# Altium project Automotive_Ethernet_Rev1.PrjPcb (part 1 of 4)
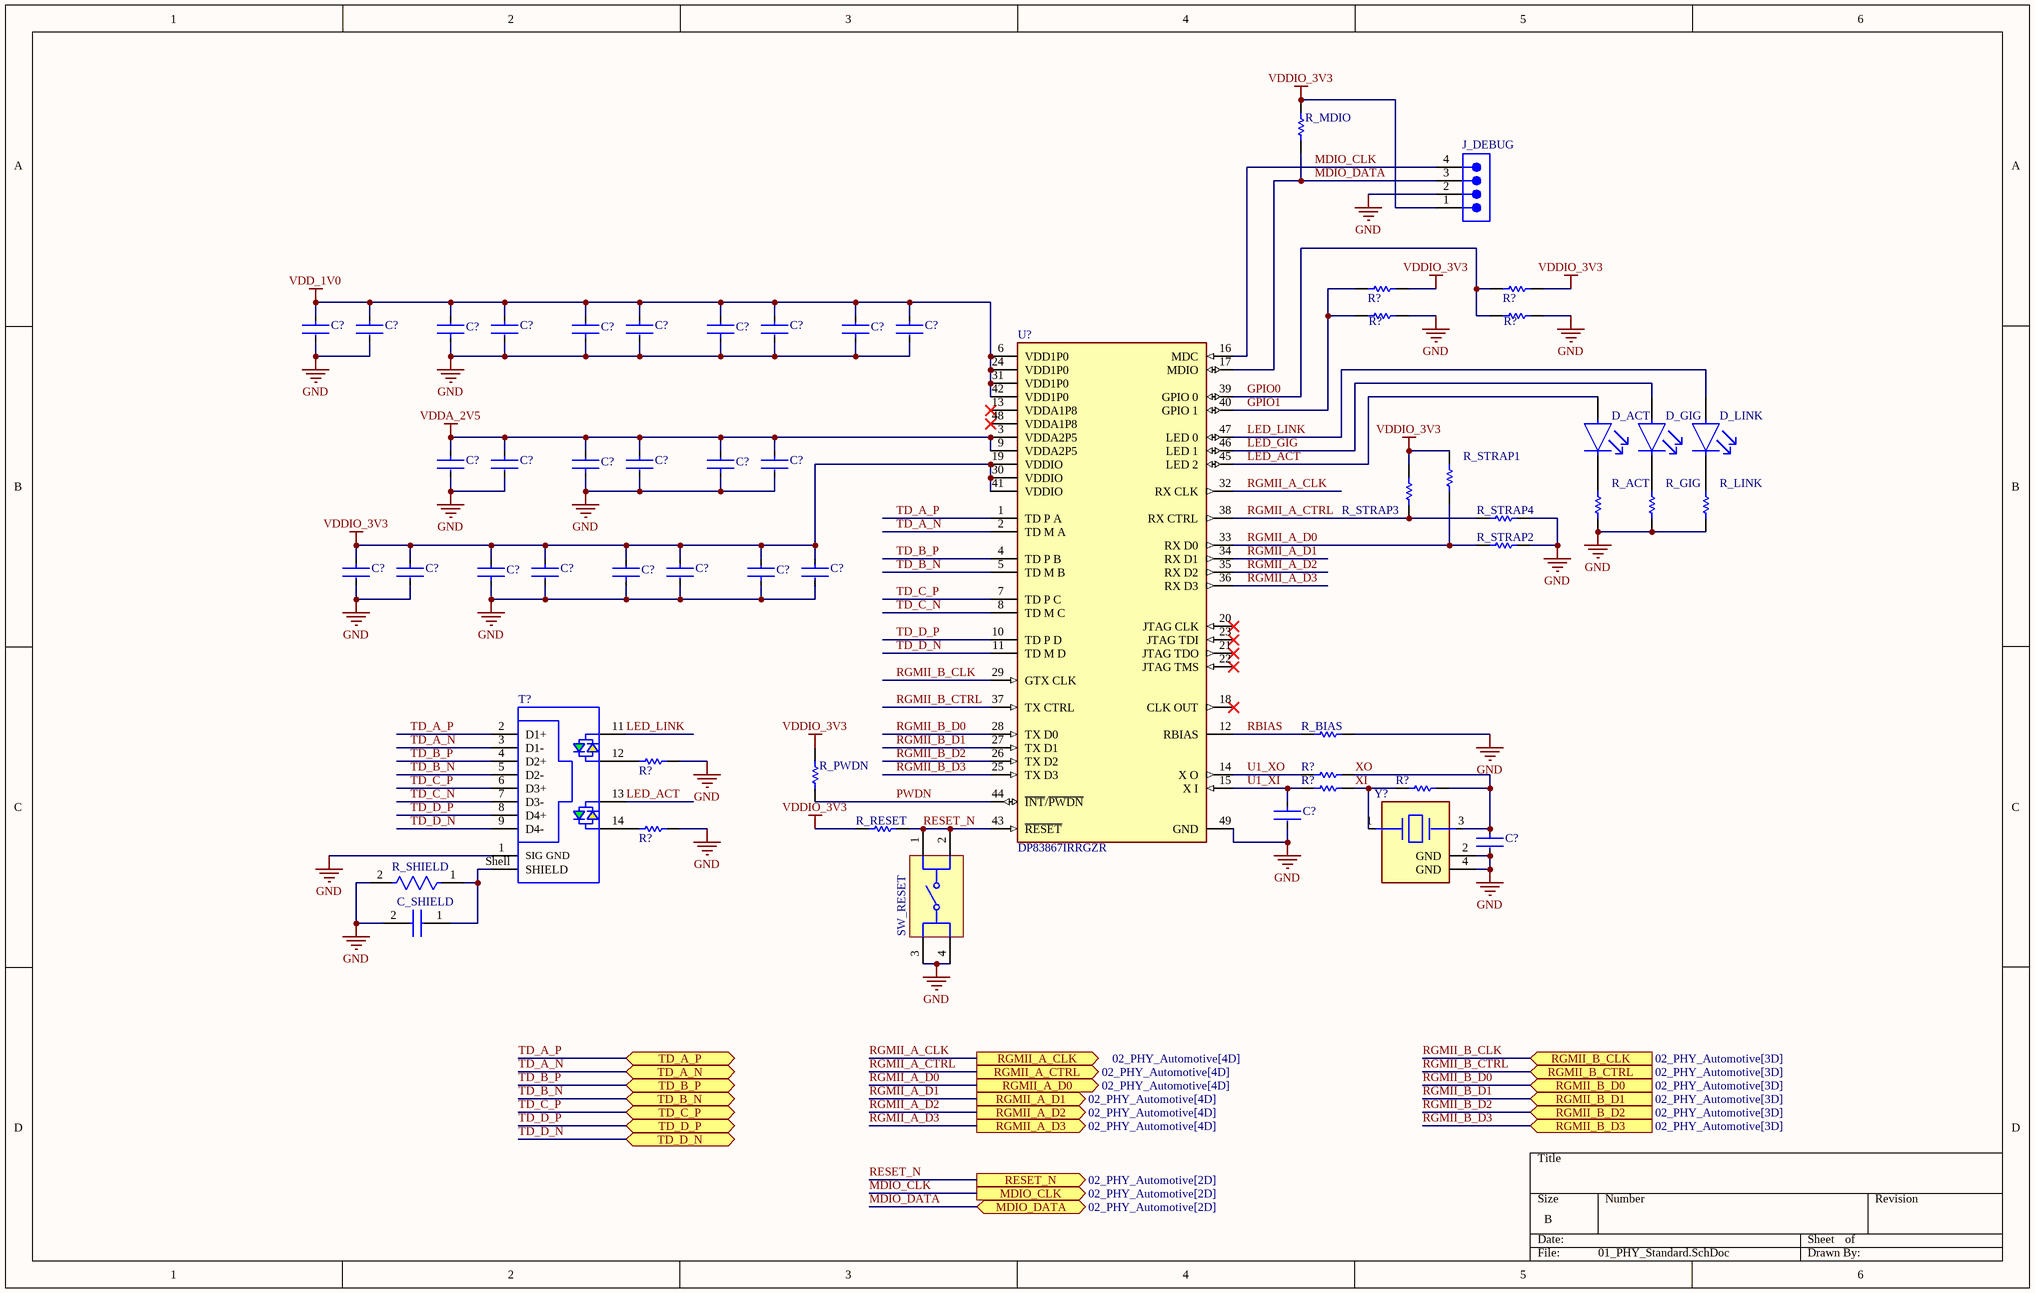
[diagram p0: 01_PHY_Standard.SchDoc]
5 sheets, 134 parts. Net scope: flat (ports and power ports of the same name join across sheets).
Board file: PCB1.PcbDoc
Sheets:
  01_PHY_Standard.SchDoc
  02_PHY_Automotive.SchDoc
  03_Clock_Control.SchDoc
  04_Power.SchDoc
  05_Connectors_Protection.SchDoc

## Sheet 01_PHY_Standard.SchDoc
size B; SheetNumber: 1; SheetTotal: 5

### Parts
(Parts that share a designator on the sheet are numbered #1, #2 ... from top to bottom, then left to right.)
C?#1  C1206C106K4RACAUTO  [FP-C1206C-EH-MFG]  (value not drawn)
C?#2  AC0402KRX7R7BB103  [FP-AC0402-0_5-MFG]  (value not drawn)
C?#3  GCG155R71C104KA01D  [FP-GCG155-0_1-IPC_C]  (value not drawn)
C?#4  GCG155R71C104KA01D  [FP-GCG155-0_1-IPC_C]  (value not drawn)
C?#5  GCG155R71C104KA01D  [FP-GCG155-0_1-IPC_C]  (value not drawn)
C?#6  GCG155R71C104KA01D  [FP-GCG155-0_1-IPC_C]  (value not drawn)
C?#7  C0603C105K8RACAUTO  [FP-C0603-CJ-MFG]  (value not drawn)
C?#8  C0603C105K8RACAUTO  [FP-C0603-CJ-MFG]  (value not drawn)
C?#9  C0603C105K8RACAUTO  [FP-C0603-CJ-MFG]  (value not drawn)
C?#10  C0603C105K8RACAUTO  [FP-C0603-CJ-MFG]  (value not drawn)
C?#11  C1206C106K4RACAUTO  [FP-C1206C-EH-MFG]  (value not drawn)
C?#12  AC0402KRX7R7BB103  [FP-AC0402-0_5-MFG]  (value not drawn)
C?#13  GCG155R71C104KA01D  [FP-GCG155-0_1-IPC_C]  (value not drawn)
C?#14  GCG155R71C104KA01D  [FP-GCG155-0_1-IPC_C]  (value not drawn)
C?#15  C0603C105K8RACAUTO  [FP-C0603-CJ-MFG]  (value not drawn)
C?#16  C0603C105K8RACAUTO  [FP-C0603-CJ-MFG]  (value not drawn)
C?#17  C1206C106K4RACAUTO  [FP-C1206C-EH-MFG]  (value not drawn)
C?#18  AC0402KRX7R7BB103  [FP-AC0402-0_5-MFG]  (value not drawn)
C?#19  GCG155R71C104KA01D  [FP-GCG155-0_1-IPC_C]  (value not drawn)
C?#20  GCG155R71C104KA01D  [FP-GCG155-0_1-IPC_C]  (value not drawn)
C?#21  GCG155R71C104KA01D  [FP-GCG155-0_1-IPC_C]  (value not drawn)
C?#22  C0603C105K8RACAUTO  [FP-C0603-CJ-MFG]  (value not drawn)
C?#23  C0603C105K8RACAUTO  [FP-C0603-CJ-MFG]  (value not drawn)
C?#24  C0603C105K8RACAUTO  [FP-C0603-CJ-MFG]  (value not drawn)
C?#25  AC0402FRNPO9BN270  [FP-AC0402-0_5-MFG]  (value not drawn)
C?#26  AC0402FRNPO9BN270  [FP-AC0402-0_5-MFG]  (value not drawn)
C_SHIELD  C1812C472KGRACAUTO  [C1812]  (value not drawn)
D_ACT  SML-D12P8WT86C  [FP-SML-D12-MFG]  (value not drawn)
D_GIG  SML-D12P8WT86C  [FP-SML-D12-MFG]  (value not drawn)
D_LINK  SML-D12P8WT86C  [FP-SML-D12-MFG]  (value not drawn)
J_DEBUG  MTSW-104-07-F-S-170  [SMTC-MTSW-104-07-X-S-170]  (value not drawn)
R?#1  AC0402FR-075K76L  [FP-AC0402-IPC_A]  (value not drawn)
R?#2  AC0402FR-075K76L  [FP-AC0402-IPC_A]  (value not drawn)
R?#3  AC0402FR-072K49L  [FP-AC0402-IPC_A]  (value not drawn)
R?#4  AC0402FR-072K49L  [FP-AC0402-IPC_A]  (value not drawn)
R?#5  AC0402JR-13470RL  [FP-AC0402-IPC_A]  (value not drawn)
R?#6  AF0402JR-070RL  [FP-AC0402-IPC_A]  (value not drawn)
R?#7  AF0402JR-070RL  [FP-AC0402-IPC_A]  (value not drawn)
R?#8  AF0402JR-071ML  [FP-AC0402-IPC_A]  (value not drawn)
R?#9  AC0402JR-13470RL  [FP-AC0402-IPC_A]  (value not drawn)
R_ACT  AC0402JR-13470RL  [FP-AC0402-IPC_A]  (value not drawn)
R_BIAS  AC0402FR-0711KL  [FP-AC0402-IPC_A]  (value not drawn)
R_GIG  AC0402JR-13470RL  [FP-AC0402-IPC_A]  (value not drawn)
R_LINK  AC0402JR-13470RL  [FP-AC0402-IPC_A]  (value not drawn)
R_MDIO  CRCW04022K20FKTD  [FP-AC0402-IPC_A]  (value not drawn)
R_PWDN  CRCW04022K20FKTD  [FP-AC0402-IPC_A]  (value not drawn)
R_RESET  AC0402JR-1310KL  [FP-AC0402-IPC_A]  (value not drawn)
R_SHIELD  AF1206JR-071ML  [FP-AF1206-MFG]  (value not drawn)
R_STRAP1  AC0402JR-1310KL  [FP-AC0402-IPC_A]  (value not drawn)
R_STRAP2  AC0402FR-072K49L  [FP-AC0402-IPC_A]  (value not drawn)
R_STRAP3  AC0402FR-075K76L  [FP-AC0402-IPC_A]  (value not drawn)
R_STRAP4  AC0402FR-072K49L  [FP-AC0402-IPC_A]  (value not drawn)
SW_RESET  430473035826  [430473035826]  (value not drawn)
T?  74991104404  [74991104404]  (value not drawn)
U?#1  DP83867IRRGZR  [FP-RGZ0048B-MFG]
Y?#1  TSX-3225 25.0000MF10P-C0  [FP-TSX-3225-MFG]  (value not drawn)

### Ports
MDIO_CLK (out, see 02_PHY_Automotive[2D]), MDIO_DATA (bidir, see 02_PHY_Automotive[2D]), RESET_N (out, see 02_PHY_Automotive[2D]), RGMII_A_CLK (out, see 02_PHY_Automotive[4D]), RGMII_A_CTRL (out, see 02_PHY_Automotive[4D]), RGMII_A_D0 (out, see 02_PHY_Automotive[4D]), RGMII_A_D1 (out, see 02_PHY_Automotive[4D]), RGMII_A_D2 (out, see 02_PHY_Automotive[4D]), RGMII_A_D3 (out, see 02_PHY_Automotive[4D]), RGMII_B_CLK (in, see 02_PHY_Automotive[3D]), RGMII_B_CTRL (in, see 02_PHY_Automotive[3D]), RGMII_B_D0 (in, see 02_PHY_Automotive[3D]), RGMII_B_D1 (in, see 02_PHY_Automotive[3D]), RGMII_B_D2 (in, see 02_PHY_Automotive[3D]), RGMII_B_D3 (in, see 02_PHY_Automotive[3D]), TD_A_N (bidir), TD_A_P (bidir), TD_B_N (bidir), TD_B_P (bidir), TD_C_P (bidir), TD_D_N (bidir), TD_D_P (bidir)

### Nets
GND: C?#1.2 C?#2.2 C?#3.2 C?#4.2 C?#5.2 C?#6.2 C?#7.2 C?#8.2 C?#9.2 C?#10.2 C?#11.2 C?#12.2 C?#13.2 C?#14.2 C?#15.2 C?#16.2 C?#17.2 C?#18.2 C?#19.2 C?#20.2 C?#21.2 C?#22.2 C?#23.2 C?#24.2 C?#25.2 C?#26.2 C_SHIELD.2 J_DEBUG.2 R?#3.1 R?#4.1 R?#5.2 R?#9.2 R_ACT.2 R_BIAS.1 R_GIG.2 R_LINK.2 R_SHIELD.2 R_STRAP2.1 R_STRAP4.1 SW_RESET.3 SW_RESET.4 T?.1(SIG_GND) U?#1.49(GND) Y?#1.2(GND) Y?#1.4(GND)
VDD_1V0: C?#1.1 C?#2.1 C?#3.1 C?#4.1 C?#5.1 C?#6.1 C?#7.1 C?#8.1 C?#9.1 C?#10.1 U?#1.6(VDD1P0) U?#1.24(VDD1P0) U?#1.31(VDD1P0) U?#1.42(VDD1P0)
VDDA_2V5: C?#11.1 C?#12.1 C?#13.1 C?#14.1 C?#15.1 C?#16.1 U?#1.3(VDDA2P5) U?#1.9(VDDA2P5)
VDDIO_3V3: C?#17.1 C?#18.1 C?#19.1 C?#20.1 C?#21.1 C?#22.1 C?#23.1 C?#24.1 J_DEBUG.1 R?#1.2 R?#2.2 R_MDIO.1 R_PWDN.1 R_RESET.2 R_STRAP1.1 R_STRAP3.1 U?#1.19(VDDIO) U?#1.30(VDDIO) U?#1.41(VDDIO)
GPIO0: R?#2.1 R?#4.2 U?#1.39(GPIO_0)
GPIO1: R?#1.1 R?#3.2 U?#1.40(GPIO_1)
LED_ACT: D_ACT.2(A) T?.13 U?#1.45(LED_2)
LED_GIG: D_GIG.2(A) U?#1.46(LED_1)
LED_LINK: D_LINK.2(A) T?.11 U?#1.47(LED_0)
MDIO_CLK: J_DEBUG.4 U?#1.16(MDC) ; port MDIO_CLK
MDIO_DATA: J_DEBUG.3 R_MDIO.2 U?#1.17(MDIO) ; port MDIO_DATA
PWDN: R_PWDN.2 U?#1.44(~{INT}/~{PWDN})
RBIAS: R_BIAS.2 U?#1.12(RBIAS)
RESET_N: R_RESET.1 SW_RESET.1 SW_RESET.2 U?#1.43(~{RESET}) ; port RESET_N
RGMII_A_CLK: U?#1.32(RX_CLK) ; port RGMII_A_CLK
RGMII_A_CTRL: R_STRAP3.2 R_STRAP4.2 U?#1.38(RX_CTRL) ; port RGMII_A_CTRL
RGMII_A_D0: R_STRAP1.2 R_STRAP2.2 U?#1.33(RX_D0) ; port RGMII_A_D0
RGMII_A_D1: U?#1.34(RX_D1) ; port RGMII_A_D1
RGMII_A_D2: U?#1.35(RX_D2) ; port RGMII_A_D2
RGMII_A_D3: U?#1.36(RX_D3) ; port RGMII_A_D3
RGMII_B_CLK: U?#1.29(GTX_CLK) ; port RGMII_B_CLK
RGMII_B_CTRL: U?#1.37(TX_CTRL) ; port RGMII_B_CTRL
RGMII_B_D0: U?#1.28(TX_D0) ; port RGMII_B_D0
RGMII_B_D1: U?#1.27(TX_D1) ; port RGMII_B_D1
RGMII_B_D2: U?#1.26(TX_D2) ; port RGMII_B_D2
RGMII_B_D3: U?#1.25(TX_D3) ; port RGMII_B_D3
TD_A_N: T?.3(D1-) U?#1.2(TD_M_A) ; port TD_A_N
TD_A_P: T?.2(D1+) U?#1.1(TD_P_A) ; port TD_A_P
TD_B_N: T?.5(D2-) U?#1.5(TD_M_B) ; port TD_B_N
TD_B_P: T?.4(D2+) U?#1.4(TD_P_B) ; port TD_B_P
TD_C_N: T?.7(D3-) U?#1.8(TD_M_C)
TD_C_P: T?.6(D3+) U?#1.7(TD_P_C) ; port TD_C_P
TD_D_N: T?.9(D4-) U?#1.11(TD_M_D) ; port TD_D_N
TD_D_P: T?.8(D4+) U?#1.10(TD_P_D) ; port TD_D_P
U1_XI: C?#25.1 R?#7.2 U?#1.15(X_I)
U1_XO: R?#6.2 U?#1.14(X_O)
XI: R?#7.1 R?#8.2 Y?#1.1
XO: C?#26.1 R?#6.1 R?#8.1 Y?#1.3
NetC_SHIELD_1: C_SHIELD.1 R_SHIELD.1 T?.Shell(SHIELD)
NetD_ACT_1: D_ACT.1(C) R_ACT.1
NetD_GIG_1: D_GIG.1(C) R_GIG.1
NetD_LINK_1: D_LINK.1(C) R_LINK.1
NetR?#5_1: R?#5.1 T?.12
NetR?#9_1: R?#9.1 T?.14

Not connected (* = marked no-connect by the designer): U?#1 13(VDDA1P8)* 18(CLK_OUT)* 20(JTAG_CLK)* 21(JTAG_TDO)* 22(JTAG_TMS)* 23(JTAG_TDI)* 48(VDDA1P8)*

### Library data of the parts
C?#1 C?#11 C?#17 = CMP-03020-003375-1: CAP CER 10UF 16V X7R 1206; Manufacturer: Kemet; Material: Ceramic; Temperature Coefficient: 15%; Tolerance: 10%; Automotive Grade: Grade 1; Manufacturer Part Number: C1206C106K4RACAUTO; Digikey Description: CAP CER 10UF 16V X7R 1206; RoHS: TRUE; Temperature Range Low: -55°C; Ipc Land Pattern Name: CAPC320160X160; Category: Cap; Mouser Description: Multilayer Ceramic Capacitors MLCC - SMD/SMT 10uF 16V 10% AUTO; Device Class L1: Passive Components; Automotive: Yes; ComponentLink2Description: Datasheet; Octopart: https://octopart.com/c1206c106k4racauto-kemet-20072893; Package: C1206C-EH; Temperature: -55°C to +125°C; Device Class L3: Ceramic Capacitors; Device Class L2: Capacitors; Temperature Range High: +125°C; Capacitance: 10uF; Value: 10uF; Lead Free: Yes; Height: 1.8mm; Temperature Characteristic: X7R; ComponentLink2URL: https://content.kemet.com/datasheets/KEM_C1023_X7R_AUTO_SMD.pdf; Voltage Rating: 16V
C?#2 C?#12 C?#18 = CMP-03422-001135-1: CAP CER 10000PF 16V X7R 0402; Manufacturer: Yageo; Value: 10 nF; Automotive Grade: Grade 1; Temperature Coefficient: ±15%; Tolerance: 0.1; Material: Ceramic; Octopart: https://octopart.com/ac0402krx7r7bb103-yageo-76900920; Height: 0.55mm; Footprint Url: http://www.yageo.com/exep/pages/download/literatures/UPY-C_GEN_24.pdf; Lead Free: Yes; RoHS: TRUE; Digikey Description: CAP CER 10000PF 16V X7R 0402; Temperature Range Low: -55°C; Device Class L1: Passive Components; Voltage Rating: 16 V; Temperature: -55°C to +125°C; Capacitance: 10 nF; Package: AC0402-0.5; ComponentLink2Description: Datasheet; Device Class L3: Ceramic Capacitors; Temperature Range High: +125°C; Ipc Land Pattern Name: CAPC10050X50; Device Class L2: Capacitors; Temperature Characteristic: X7R; Category: Cap; ComponentLink2URL: http://www.yageo.com/documents/recent/UPY-AC_NP0X7R_16V-to-630V_12.pdf; Manufacturer Part Number: AC0402KRX7R7BB103; Automotive: Yes
C?#3-C?#6 C?#13 C?#14 C?#19-C?#21 = CMP-06035-054249-1: Cap Ceramic Multilayer Automotive 0.1uF ±0.1 16VDC X7R 15% 0402 (1005M); Capacitance: 100nF; Tolerance: 10%; Voltage Rating (DC): 16V; Lead Free: Lead Free; Dielectric: X7R
C?#7-C?#10 C?#15 C?#16 C?#22-C?#24 = CMP-03020-024138-1: CAP CER 0603 1UF 10V X7R 10%; Manufacturer: KEMET; Temperature Coefficient: 15%; Automotive Grade: Grade 1; Material: Ceramic; Device Class L3: Ceramic Capacitors; Octopart: https://octopart.com/c0603c105k8racauto-kemet-91328492; Capacitance: 1uF; Voltage Rating: 10V; Device Class L2: Capacitors; Lead Free: Yes; Device Class L1: Passive Components; ComponentLink2URL: https://content.kemet.com/datasheets/KEM_C1023_X7R_AUTO_SMD.pdf; Temperature Characteristic: X7R; Temperature Range Low: -55°C; Temperature Range High: +125°C; Category: Cap; Ipc Land Pattern Name: CAPC16080X80; Tolerance: 10%; Package: C0603-CJ; Manufacturer Part Number: C0603C105K8RACAUTO; ComponentLink2Description: Datasheet; Temperature: -55°C to +125°C; RoHS: TRUE; Value: 1uF; Height: 0.95mm; Automotive: Yes; Digikey Description: CAP CER 0603 1UF 10V X7R 10%
C?#25 C?#26 = CMP-03422-000145-1: AC0402 27 pF NPO 1.00% 50 V; Manufacturer: Yageo; Tolerance: 0.01; Voltage Rating: 50 V; Capacitance: 27 pF; Material: Ceramic; Value: 27 pF; Automotive Grade: Grade 1; Temperature Coefficient: 30ppm/°C; Temperature: -55°C to +125°C; Octopart: https://octopart.com/ac0402frnpo9bn270-yageo-87213989; RoHS: TRUE; Ipc Land Pattern Name: CAPC10050X50; Package: AC0402-0.5; Category: Cap; Device Class L2: Capacitors; Device Class L1: Passive Components; Manufacturer Part Number: AC0402FRNPO9BN270; Automotive: Yes; Device Class L3: Ceramic Capacitors; Footprint Url: http://www.yageo.com/exep/pages/download/literatures/UPY-C_GEN_24.pdf; Temperature Range High: +125°C; Temperature Characteristic: NPO; Height: 0.55mm; ComponentLink2Description: Datasheet; Temperature Range Low: -55°C; Lead Free: Yes; ComponentLink2URL: http://www.yageo.com/documents/recent/UPY-AC_NP0X7R_16V-to-630V_12.pdf
C_SHIELD = C1812C472KGRACAUTO: Capacitor; Manufacturer_Name: Yageo Group; Datasheet Link: https://www.yageogroup.com/content/datasheet/asset/file/KEM_C1076_X7R_HV_AUTO_SMD; Height: 1.55mm; Manufacturer_Part_Number: C1812C472KGRACAUTO; Mouser Part Number: 80-C1812C472KGRAUTO; Mouser Price/Stock: https://www.mouser.co.uk/ProductDetail/KEMET/C1812C472KGRACAUTO?qs=f9yNj16SXrLK%252BHmDDKifeA%3D%3D; Arrow Part Number: C1812C472KGRACAUTO; Arrow Price/Stock: https://www.arrow.com/en/products/c1812c472kgracauto/kemet-corporation
D_ACT D_GIG D_LINK = CMP-08952-000001-1: LED GREEN 1608 SMD; Manufacturer: Rohm; Forward Current: 20mA; Luminous Intensity: 6.3mcd; Wavelength: 560nm; Automotive Grade: Grade 3; Reverse Voltage: 5V; Forward Voltage: 2.2V; Power Dissipation: 54mW; Led Orientation: Top View; Temperature Range Low: -40°C; Automotive: Yes; Height: 0.65mm; Manufacturer Part Number: SML-D12P8WT86C; Device Class L3: unset; Octopart: https://octopart.com/sml-d12p8wt86c-rohm-77740213; Lead Free: Yes; Digikey Description: LED GREEN 1608 SMD; Temperature Range High: +85°C; ComponentLink2URL: https://www.rohm.com/datasheet/SML-D12P8W(C)/sml-d12x8(c)-e; ComponentLink2Description: Datasheet; RoHS: TRUE; Device Class L2: LEDs; Package: SML-D12; Category: Diode; Temperature: -40°C to +85°C; Mouser Description: LED Uni-Color Green Automotive 2-Pin Chip 0603(1608Metric) T/R; Colour: Green; Device Class L1: Optoelectronics
J_DEBUG = CMP-1024-00106-1: Modified .025" SQ Post Header, Through-hole, Vertical, -55 to 125 degC, 2.54 mm Pitch, 4-Pin, Male, RoHS; Manufacturer: Samtec; Pitch: 2.54 mm; Orientation: Vertical; ComponentLink1Description: Manufacturer URL; ComponentLink2Description: Datasheet; PackageReference: MTSW-104-07-X-S-170; PackageDescription: Assembly .025" [.64] SQ Post Terminal Strip; Temperature Range: -55 to 125 degC; PackageVersion: BI, 2/1987; PartNumber: MTSW-104-07-F-S-170; Mounting Technology: Through-hole; ComponentLink2URL: http://www.samtec.com/documents/webfiles/pdf/MTSW.PDF; ComponentLink3URL: http://www.samtec.com/documents/webfiles/cpdf/MTSW-XXX-XX-X-X-XXXX-XX-XXX-MKT1.pdf; DatasheetVersion: F-214; RoHS: True; ComponentLink3Description: Package Specification; ComponentLink1URL: http://www.samtec.com
R?#1 R?#2 R_STRAP3 = CMP-2002-07181-1: Fixed Resistor, Metal Glaze/Thick Film, 0.0625W, 5760ohm, 50V, 1% +/-Tol, Surface Mount, 0402; Manufacturer: Yageo Group; Max Power Dissipation: 63mW; Power Rating: 62.5mW; Value: 5.76kΩ; Temperature Coefficient: 100ppm/°C; Supplier: Future Electronics; Supplier Part Number: AC0402FR-075K76L; Manufacturer Part Number: AC0402FR-075K76L; RoHS: Compliant; Category: Chip SMD Resistors; Stock: 40000; Pricing: 10000=0.0061, 30000=0.0059, 50000=0.0059, 150000=0.0057, 250000=0.0056 (USD); Case/Package: 0402; Case Code (Imperial): 0402; Case Code (Metric): 1005; China RoHS: Non-Compliant; Composition: Thick Film; Country of Origin: Mainland China, Taiwan; Export Control Classification Number (ECCN) Code: EAR99; Features: Automotive AEC-Q200, Moisture Resistant; Height: 320µm; Harmonized Tariff Schedule (HTS) Code: 8533.21.00.30; Introduction Date: 2012-04-10; Length: 1mm; Lifecycle Status: Production; Max Operating Temperature: 155°C; Min Operating Temperature: -55°C; Mounting Technology: Surface Mount; Number of Terminals: 2; Number of Terminations: 2; Packaging: Tape & Reel; Ratings: AEC-Q200; REACH SVHC: Unaffected; Termination: SMD/SMT; Tolerance: 1%; Voltage Rating: 50V; Width: 500µm; Working Voltage: 50V; ComponentLink1URL: https://datasheet.octopart.com:443/AC0402FR-075K76L-Yageo-datasheet-182189377.pdf?src-supplier=IHS; ComponentLink1Description: https://datasheet.octopart.com:443/AC0402FR-075K76L-Yageo-datasheet-182189377.pdf?src-supplier=IHS; ComponentLink2URL: https://datasheet.octopart.com:443/AC0402FR-075K76L-Yageo-datasheet-83209224.pdf?src-supplier=Upverter; ComponentLink2Description: https://datasheet.octopart.com:443/AC0402FR-075K76L-Yageo-datasheet-83209224.pdf?src-supplier=Upverter; ComponentLink3URL: https://datasheet.octopart.com:443/AC0402FR-075K76L-Yageo-datasheet-178509465.pdf?src-supplier=Farnell; ComponentLink3Description: https://datasheet.octopart.com:443/AC0402FR-075K76L-Yageo-datasheet-178509465.pdf?src-supplier=Farnell; ComponentLink4URL: https://datasheet.octopart.com:443/AC0402FR-075K76L-Yageo-Group-datasheet-189830439.pdf?src-supplier=Future+Electronics; ComponentLink4Description: https://datasheet.octopart.com:443/AC0402FR-075K76L-Yageo-Group-datasheet-189830439.pdf?src-supplier=Future+Electronics; ComponentLink5URL: https://datasheet.octopart.com:443/AC0402FR-075K76L-Yageo-datasheet-166720450.pdf?src-supplier=Future+Electronics; ComponentLink5Description: https://datasheet.octopart.com:443/AC0402FR-075K76L-Yageo-datasheet-166720450.pdf?src-supplier=Future+Electronics; ComponentLink6URL: https://datasheet.octopart.com:443/AC0402FR-075K76L-Yageo-datasheet-151884373.pdf?src-supplier=Future+Electronics; ComponentLink6Description: https://datasheet.octopart.com:443/AC0402FR-075K76L-Yageo-datasheet-151884373.pdf?src-supplier=Future+Electronics; ComponentLink7URL: https://datasheet.octopart.com:443/AC0402FR-075K76L-Yageo-Group-datasheet-188689268.pdf?src-supplier=LCSC; ComponentLink7Description: https://datasheet.octopart.com:443/AC0402FR-075K76L-Yageo-Group-datasheet-188689268.pdf?src-supplier=LCSC; ComponentLink8URL: https://datasheet.octopart.com:443/AC0402FR-075K76L-Yageo-Group-datasheet-164768995.pdf?src-supplier=ODG+(Origin+Data+Global); ComponentLink8Description: https://datasheet.octopart.com:443/AC0402FR-075K76L-Yageo-Group-datasheet-164768995.pdf?src-supplier=ODG+(Origin+Data+Global); ComponentLink9URL: https://datasheet.octopart.com/AC0402FR-075K76L-Yageo-datasheet-12512238.pdf; ComponentLink9Description: https://datasheet.octopart.com/AC0402FR-075K76L-Yageo-datasheet-12512238.pdf; ComponentLink10URL: http://sigma.octopart.com:80/conflict_mineral_statement/Yageo-company-3.pdf?src-supplier=Compliance+Statements; ComponentLink10Description: http://sigma.octopart.com:80/conflict_mineral_statement/Yageo-company-3.pdf?src-supplier=Compliance+Statements; ComponentLink11URL: http://sigma.octopart.com:80/rohs_statement/Yageo-company-2.pdf?src-supplier=Compliance+Statements; ComponentLink11Description: http://sigma.octopart.com:80/rohs_statement/Yageo-company-2.pdf?src-supplier=Compliance+Statements
R?#3 R?#4 R_STRAP2 R_STRAP4 = CMP-2002-07181-1: Res Thick Film 0402 2.49K Ohm 1% 0.063W(1/16W) ±100ppm/C Pad SMD Automotive T/R; Manufacturer: Yageo Group; Max Power Dissipation: 63mW; Power Rating: 62.5mW; Value: 2.49kΩ; Temperature Coefficient: 100ppm/°C; Voltage Rating: 50V; Supplier: Mouser; Supplier Part Number: 603-AC0402FR-072K49L; Manufacturer Part Number: AC0402FR-072K49L; RoHS: Compliant; Category: Chip SMD Resistors; Stock: 227098; Pricing: 1=0.1, 10=0.013, 50=0.013, 100=0.008, 1000=0.007, 10000=0.003 (USD); Case/Package: 0402; Case Code (Imperial): 0402; Case Code (Metric): 1005; China RoHS: Non-Compliant; Composition: Thick Film; Country of Origin: Mainland China, Taiwan; Export Control Classification Number (ECCN) Code: EAR99; Features: Automotive AEC-Q200, Moisture Resistant; Height: 320µm; Harmonized Tariff Schedule (HTS) Code: 8533.21.00.30; Introduction Date: 2012-04-10; Length: 1mm; Lifecycle Status: Production; Max Operating Temperature: 155°C; Min Operating Temperature: -55°C; Mounting Technology: Surface Mount; Number of Terminals: 2; Number of Terminations: 2; Packaging: Tape & Reel; Ratings: AEC-Q200; REACH SVHC: Unaffected; Schedule B: 8533210045, 8533210045|8533210045|8533210045|8533210045|8533210045; Termination: SMD/SMT; Tolerance: 1%; Weight: 652.039032µg; Width: 500µm; Working Voltage: 50V; ComponentLink1URL: https://datasheet.octopart.com:443/AC0402FR-072K49L-Yageo-datasheet-182189377.pdf?src-supplier=IHS; ComponentLink1Description: https://datasheet.octopart.com:443/AC0402FR-072K49L-Yageo-datasheet-182189377.pdf?src-supplier=IHS; ComponentLink2URL: https://datasheet.octopart.com:443/AC0402FR-072K49L-Yageo-datasheet-83209224.pdf?src-supplier=Upverter; ComponentLink2Description: https://datasheet.octopart.com:443/AC0402FR-072K49L-Yageo-datasheet-83209224.pdf?src-supplier=Upverter; ComponentLink3URL: https://datasheet.octopart.com:443/AC0402FR-072K49L-Yageo-datasheet-178509465.pdf?src-supplier=Newark; ComponentLink3Description: https://datasheet.octopart.com:443/AC0402FR-072K49L-Yageo-datasheet-178509465.pdf?src-supplier=Newark; ComponentLink4URL: https://datasheet.octopart.com:443/AC0402FR-072K49L-Yageo-Group-datasheet-189830439.pdf?src-supplier=Future+Electronics; ComponentLink4Description: https://datasheet.octopart.com:443/AC0402FR-072K49L-Yageo-Group-datasheet-189830439.pdf?src-supplier=Future+Electronics; ComponentLink5URL: https://datasheet.octopart.com:443/AC0402FR-072K49L-Yageo-datasheet-166720450.pdf?src-supplier=Future+Electronics; ComponentLink5Description: https://datasheet.octopart.com:443/AC0402FR-072K49L-Yageo-datasheet-166720450.pdf?src-supplier=Future+Electronics; ComponentLink6URL: https://datasheet.octopart.com:443/AC0402FR-072K49L-Yageo-datasheet-151884373.pdf?src-supplier=Future+Electronics; ComponentLink6Description: https://datasheet.octopart.com:443/AC0402FR-072K49L-Yageo-datasheet-151884373.pdf?src-supplier=Future+Electronics; ComponentLink7URL: https://datasheet.octopart.com:443/AC0402FR-072K49L-Yageo-datasheet-137699919.pdf?src-supplier=Future+Electronics; ComponentLink7Description: https://datasheet.octopart.com:443/AC0402FR-072K49L-Yageo-datasheet-137699919.pdf?src-supplier=Future+Electronics; ComponentLink8URL: https://datasheet.octopart.com:443/AC0402FR-072K49L-Yageo-Group-datasheet-188689268.pdf?src-supplier=LCSC; ComponentLink8Description: https://datasheet.octopart.com:443/AC0402FR-072K49L-Yageo-Group-datasheet-188689268.pdf?src-supplier=LCSC; ComponentLink9URL: https://datasheet.octopart.com:443/AC0402FR-072K49L-Yageo-Group-datasheet-164768995.pdf?src-supplier=ODG+(Origin+Data+Global); ComponentLink9Description: https://datasheet.octopart.com:443/AC0402FR-072K49L-Yageo-Group-datasheet-164768995.pdf?src-supplier=ODG+(Origin+Data+Global); ComponentLink10URL: https://datasheet.octopart.com/AC0402FR-072K49L-Yageo-datasheet-12512238.pdf; ComponentLink10Description: https://datasheet.octopart.com/AC0402FR-072K49L-Yageo-datasheet-12512238.pdf; ComponentLink11URL: http://sigma.octopart.com:80/conflict_mineral_statement/Yageo-company-3.pdf?src-supplier=Compliance+Statements; ComponentLink11Description: http://sigma.octopart.com:80/conflict_mineral_statement/Yageo-company-3.pdf?src-supplier=Compliance+Statements; ComponentLink12URL: http://sigma.octopart.com:80/rohs_statement/Yageo-company-2.pdf?src-supplier=Compliance+Statements; ComponentLink12Description: http://sigma.octopart.com:80/rohs_statement/Yageo-company-2.pdf?src-supplier=Compliance+Statements
R?#5 R?#9 R_ACT R_GIG R_LINK = CMP-2002-07181-1: Res Thick Film 0402 470 Ohm 5% 0.063W(1/16W) ±100ppm/C Pad SMD T/R Automotive AEC-Q200; Manufacturer: Yageo Group; Power Rating: 62.5mW; Value: 470Ω; Temperature Coefficient: 100ppm/°C; Voltage Rating: 50V; Supplier: Avnet; Supplier Part Number: AC0402JR-13470RL; Manufacturer Part Number: AC0402JR-13470RL; RoHS: Compliant; Category: Chip SMD Resistors; Pricing: 50000=0.00294, 100000=0.00293, 200000=0.00291, 400000=0.0029, 800000=0.00288 (USD); Case/Package: 0402; China RoHS: Non-Compliant; Composition: Thick Film; Height: 320µm; Length: 1mm; Lifecycle Status: Production; Max Operating Temperature: 155°C; Min Operating Temperature: -55°C; Mounting Technology: Surface Mount; Number of Terminals: 2; Packaging: Tape & Reel; Ratings: AEC-Q200; REACH SVHC: Unaffected; Tolerance: 5%; Width: 500µm; Working Voltage: 50V; ComponentLink1URL: https://datasheet.octopart.com:443/AC0402JR-13470RL-Yageo-datasheet-182189377.pdf?src-supplier=IHS; ComponentLink1Description: https://datasheet.octopart.com:443/AC0402JR-13470RL-Yageo-datasheet-182189377.pdf?src-supplier=IHS; ComponentLink2URL: https://datasheet.octopart.com:443/AC0402JR-13470RL-Yageo-datasheet-83209224.pdf?src-supplier=Upverter; ComponentLink2Description: https://datasheet.octopart.com:443/AC0402JR-13470RL-Yageo-datasheet-83209224.pdf?src-supplier=Upverter; ComponentLink3URL: https://datasheet.octopart.com:443/AC0402JR-13470RL-Yageo-datasheet-166720450.pdf?src-supplier=JRH+Electronics; ComponentLink3Description: https://datasheet.octopart.com:443/AC0402JR-13470RL-Yageo-datasheet-166720450.pdf?src-supplier=JRH+Electronics; ComponentLink4URL: https://datasheet.octopart.com/AC0402JR-13470RL-Yageo-datasheet-12512238.pdf; ComponentLink4Description: https://datasheet.octopart.com/AC0402JR-13470RL-Yageo-datasheet-12512238.pdf; ComponentLink5URL: http://sigma.octopart.com:80/conflict_mineral_statement/Yageo-company-3.pdf?src-supplier=Compliance+Statements; ComponentLink5Description: http://sigma.octopart.com:80/conflict_mineral_statement/Yageo-company-3.pdf?src-supplier=Compliance+Statements; ComponentLink6URL: http://sigma.octopart.com:80/rohs_statement/Yageo-company-2.pdf?src-supplier=Compliance+Statements; ComponentLink6Description: http://sigma.octopart.com:80/rohs_statement/Yageo-company-2.pdf?src-supplier=Compliance+Statements
R?#6 R?#7 = CMP-2002-07181-1: Res Thick Film 0402 0 Ohm Sulfur Resistant Pad SMD T/R Automotive AEC-Q200; Manufacturer: Yageo Group; Max Power Dissipation: 63mW; Power Rating: 62.5mW; Value: 0Ω; Temperature Coefficient: 100ppm/°C; Tolerance: 5%; Voltage Rating: 50V; Supplier: Mouser; Supplier Part Number: 603-AF0402JR-070RL; Manufacturer Part Number: AF0402JR-070RL; RoHS: Compliant; Category: Chip SMD Resistors; Stock: 203771; Pricing: 1=0.12, 10=0.015, 50=0.015, 100=0.010, 1000=0.009, 10000=0.006 (USD); Case/Package: 0402; Case Code (Imperial): 0402; Case Code (Metric): 1005; China RoHS: Non-Compliant; Composition: Thick Film; Country of Origin: Mainland China, Taiwan; Export Control Classification Number (ECCN) Code: EAR99; Features: Anti-Sulfur, Moisture Resistant; Height: 350µm; Harmonized Tariff Schedule (HTS) Code: 8533.21.00.30; Introduction Date: 2012-05-08; Length: 1mm; Lifecycle Status: Production; Max Operating Temperature: 155°C; Min Operating Temperature: -55°C; Mounting Technology: Surface Mount; Number of Terminals: 2; Number of Terminations: 2; Packaging: Tape & Reel; Ratings: AEC-Q200; REACH SVHC: Unaffected; Termination: SMD/SMT; Weight: 652.039032µg; Width: 500µm; ComponentLink1URL: https://datasheet.octopart.com:443/AF0402JR-070RL-Yageo-Group-datasheet-182189395.pdf?src-supplier=IHS; ComponentLink1Description: https://datasheet.octopart.com:443/AF0402JR-070RL-Yageo-Group-datasheet-182189395.pdf?src-supplier=IHS; ComponentLink2URL: https://datasheet.octopart.com:443/AF0402JR-070RL-Yageo-datasheet-182189397.pdf?src-supplier=IHS; ComponentLink2Description: https://datasheet.octopart.com:443/AF0402JR-070RL-Yageo-datasheet-182189397.pdf?src-supplier=IHS; ComponentLink3URL: https://datasheet.octopart.com:443/AF0402JR-070RL-Yageo-datasheet-153645569.pdf?src-supplier=Upverter; ComponentLink3Description: https://datasheet.octopart.com:443/AF0402JR-070RL-Yageo-datasheet-153645569.pdf?src-supplier=Upverter; ComponentLink4URL: https://sigma.octopart.com:443/138820526/technical_drawing/Yageo-AF0402JR-070RL.pdf?src-supplier=Upverter; ComponentLink4Description: https://sigma.octopart.com:443/138820526/technical_drawing/Yageo-AF0402JR-070RL.pdf?src-supplier=Upverter; ComponentLink5URL: https://datasheet.octopart.com/AF0402JR-070RL-Yageo-datasheet-68296209.pdf; ComponentLink5Description: https://datasheet.octopart.com/AF0402JR-070RL-Yageo-datasheet-68296209.pdf; ComponentLink6URL: https://datasheet.octopart.com:443/AF0402JR-070RL-Yageo-Group-datasheet-183876366.pdf?src-supplier=LCSC; ComponentLink6Description: https://datasheet.octopart.com:443/AF0402JR-070RL-Yageo-Group-datasheet-183876366.pdf?src-supplier=LCSC; ComponentLink7URL: https://datasheet.octopart.com:443/AF0402JR-070RL-Yageo-Group-datasheet-188689510.pdf?src-supplier=Farnell; ComponentLink7Description: https://datasheet.octopart.com:443/AF0402JR-070RL-Yageo-Group-datasheet-188689510.pdf?src-supplier=Farnell; ComponentLink8URL: https://datasheet.octopart.com:443/AF0402JR-070RL-Yageo-datasheet-164730775.pdf?src-supplier=Future+Electronics; ComponentLink8Description: https://datasheet.octopart.com:443/AF0402JR-070RL-Yageo-datasheet-164730775.pdf?src-supplier=Future+Electronics; ComponentLink9URL: https://datasheet.octopart.com:443/AF0402JR-070RL-Yageo-datasheet-137481464.pdf?src-supplier=Future+Electronics; ComponentLink9Description: https://datasheet.octopart.com:443/AF0402JR-070RL-Yageo-datasheet-137481464.pdf?src-supplier=Future+Electronics; ComponentLink10URL: http://sigma.octopart.com:80/conflict_mineral_statement/Yageo-company-3.pdf?src-supplier=Compliance+Statements; ComponentLink10Description: http://sigma.octopart.com:80/conflict_mineral_statement/Yageo-company-3.pdf?src-supplier=Compliance+Statements; ComponentLink11URL: http://sigma.octopart.com:80/rohs_statement/Yageo-company-2.pdf?src-supplier=Compliance+Statements; ComponentLink11Description: http://sigma.octopart.com:80/rohs_statement/Yageo-company-2.pdf?src-supplier=Compliance+Statements
R?#8 = CMP-2002-07181-1: 62.5mW Thick Film Resistors 50V ±100ppm/℃ ±5% 1MΩ 0402 Chip Resistor - Surface Mount ROHS; Manufacturer: Yageo Group; Max Power Dissipation: 63mW; Temperature Coefficient: 100ppm/°C; Supplier: Mouser; Supplier Part Number: 603-AF0402JR-071ML; Manufacturer Part Number: AF0402JR-071ML; RoHS: Compliant; Category: Chip SMD Resistors; Stock: 31653; Pricing: 1=0.1, 10=0.02, 50=0.02, 100=0.011, 1000=0.009, 10000=0.007 (USD); Case/Package: 0402; China RoHS: Non-Compliant; Composition: Thick Film; Country of Origin: Mainland China, Taiwan; Export Control Classification Number (ECCN) Code: EAR99; Features: Anti-Sulfur, Moisture Resistant; Height: 350µm; Harmonized Tariff Schedule (HTS) Code: 8533.21.00.30; Introduction Date: 2012-05-08; Length: 1mm; Lifecycle Status: Production; Max Operating Temperature: 155°C; Min Operating Temperature: -55°C; Mounting Technology: Surface Mount; Number of Terminals: 2; Number of Terminations: 2; Packaging: Tape & Reel; Power Rating: 62.5mW; Ratings: AEC-Q200; REACH SVHC: Unaffected; Value: 1MΩ; Tolerance: 5%; Voltage Rating: 50V; Width: 500µm; Working Voltage: 50V; ComponentLink1URL: https://datasheet.octopart.com:443/AF0402JR-071ML-Yageo-datasheet-182189395.pdf?src-supplier=IHS; ComponentLink1Description: https://datasheet.octopart.com:443/AF0402JR-071ML-Yageo-datasheet-182189395.pdf?src-supplier=IHS; ComponentLink2URL: https://datasheet.octopart.com:443/AF0402JR-071ML-Yageo-datasheet-153645569.pdf?src-supplier=Upverter; ComponentLink2Description: https://datasheet.octopart.com:443/AF0402JR-071ML-Yageo-datasheet-153645569.pdf?src-supplier=Upverter; ComponentLink3URL: https://sigma.octopart.com:443/138820526/technical_drawing/Yageo-AF0402JR-071ML.pdf?src-supplier=Upverter; ComponentLink3Description: https://sigma.octopart.com:443/138820526/technical_drawing/Yageo-AF0402JR-071ML.pdf?src-supplier=Upverter; ComponentLink4URL: https://datasheet.octopart.com:443/AF0402JR-071ML-Yageo-Group-datasheet-183876366.pdf?src-supplier=LCSC; ComponentLink4Description: https://datasheet.octopart.com:443/AF0402JR-071ML-Yageo-Group-datasheet-183876366.pdf?src-supplier=LCSC; ComponentLink5URL: https://datasheet.octopart.com:443/AF0402JR-071ML-Yageo-datasheet-164730775.pdf?src-supplier=Future+Electronics; ComponentLink5Description: https://datasheet.octopart.com:443/AF0402JR-071ML-Yageo-datasheet-164730775.pdf?src-supplier=Future+Electronics; ComponentLink6URL: https://datasheet.octopart.com:443/AF0402JR-071ML-Yageo-datasheet-137481464.pdf?src-supplier=Future+Electronics; ComponentLink6Description: https://datasheet.octopart.com:443/AF0402JR-071ML-Yageo-datasheet-137481464.pdf?src-supplier=Future+Electronics; ComponentLink7URL: https://datasheet.octopart.com/AF0402JR-071ML-Yageo-datasheet-68296209.pdf; ComponentLink7Description: https://datasheet.octopart.com/AF0402JR-071ML-Yageo-datasheet-68296209.pdf; ComponentLink8URL: http://sigma.octopart.com:80/conflict_mineral_statement/Yageo-company-3.pdf?src-supplier=Compliance+Statements; ComponentLink8Description: http://sigma.octopart.com:80/conflict_mineral_statement/Yageo-company-3.pdf?src-supplier=Compliance+Statements; ComponentLink9URL: http://sigma.octopart.com:80/rohs_statement/Yageo-company-2.pdf?src-supplier=Compliance+Statements; ComponentLink9Description: http://sigma.octopart.com:80/rohs_statement/Yageo-company-2.pdf?src-supplier=Compliance+Statements
R_BIAS = CMP-2002-07181-1: Res Thick Film 0402 11K Ohm 1% 0.063W(1/16W) ±100ppm/C Pad SMD T/R Automotive AEC-Q200; Manufacturer: Yageo Group; Max Power Dissipation: 63mW; Power Rating: 62.5mW; Value: 11kΩ; Temperature Coefficient: 100ppm/°C; Voltage Rating: 50V; Supplier: Future Electronics; Supplier Part Number: AC0402FR-0711KL; Manufacturer Part Number: AC0402FR-0711KL; RoHS: Compliant; Category: Chip SMD Resistors; Stock: 20000; Pricing: 10000=0.0037, 40000=0.0036, 150000=0.0035, 250000=0.0034, 500000=0.0033 (USD); Case/Package: 0402; Case Code (Imperial): 0402; Case Code (Metric): 1005; China RoHS: Non-Compliant; Composition: Thick Film; Features: Automotive AEC-Q200, Moisture Resistant; Height: 320µm; Lead Free: Lead Free; Length: 1mm; Lifecycle Status: Production; Max Operating Temperature: 155°C; Min Operating Temperature: -55°C; Mounting Technology: Surface Mount; Number of Terminals: 2; Number of Terminations: 2; Packaging: Tape & Reel; Ratings: AEC-Q200; REACH SVHC: Unaffected; Schedule B: 8533210045, 8533210045|8533210045, 8533210045|8533210045|8533210045, 8533210045|8533210045|8533210045|8533210045; Tolerance: 1%; Width: 500µm; Working Voltage: 50V; ComponentLink1URL: https://datasheet.octopart.com:443/AC0402FR-0711KL-Yageo-datasheet-182189377.pdf?src-supplier=IHS; ComponentLink1Description: https://datasheet.octopart.com:443/AC0402FR-0711KL-Yageo-datasheet-182189377.pdf?src-supplier=IHS; ComponentLink2URL: https://datasheet.octopart.com:443/AC0402FR-0711KL-Yageo-datasheet-83209224.pdf?src-supplier=Upverter; ComponentLink2Description: https://datasheet.octopart.com:443/AC0402FR-0711KL-Yageo-datasheet-83209224.pdf?src-supplier=Upverter; ComponentLink3URL: https://datasheet.octopart.com:443/AC0402FR-0711KL-Yageo-datasheet-178509465.pdf?src-supplier=Newark; ComponentLink3Description: https://datasheet.octopart.com:443/AC0402FR-0711KL-Yageo-datasheet-178509465.pdf?src-supplier=Newark; ComponentLink4URL: https://datasheet.octopart.com/AC0402FR-0711KL-Yageo-datasheet-12512238.pdf; ComponentLink4Description: https://datasheet.octopart.com/AC0402FR-0711KL-Yageo-datasheet-12512238.pdf; ComponentLink5URL: https://datasheet.octopart.com:443/AC0402FR-0711KL-Yageo-Group-datasheet-189830439.pdf?src-supplier=Future+Electronics; ComponentLink5Description: https://datasheet.octopart.com:443/AC0402FR-0711KL-Yageo-Group-datasheet-189830439.pdf?src-supplier=Future+Electronics; ComponentLink6URL: https://datasheet.octopart.com:443/AC0402FR-0711KL-Yageo-datasheet-166720450.pdf?src-supplier=Future+Electronics; ComponentLink6Description: https://datasheet.octopart.com:443/AC0402FR-0711KL-Yageo-datasheet-166720450.pdf?src-supplier=Future+Electronics; ComponentLink7URL: https://datasheet.octopart.com:443/AC0402FR-0711KL-Yageo-datasheet-151884373.pdf?src-supplier=Future+Electronics; ComponentLink7Description: https://datasheet.octopart.com:443/AC0402FR-0711KL-Yageo-datasheet-151884373.pdf?src-supplier=Future+Electronics; ComponentLink8URL: https://datasheet.octopart.com:443/AC0402FR-0711KL-Yageo-datasheet-137699919.pdf?src-supplier=Future+Electronics; ComponentLink8Description: https://datasheet.octopart.com:443/AC0402FR-0711KL-Yageo-datasheet-137699919.pdf?src-supplier=Future+Electronics; ComponentLink9URL: https://datasheet.octopart.com:443/AC0402FR-0711KL-Yageo-datasheet-24580492.pdf?src-supplier=Future+Electronics; ComponentLink9Description: https://datasheet.octopart.com:443/AC0402FR-0711KL-Yageo-datasheet-24580492.pdf?src-supplier=Future+Electronics; ComponentLink10URL: https://datasheet.octopart.com:443/AC0402FR-0711KL-Yageo-datasheet-13029202.pdf?src-supplier=Future+Electronics; ComponentLink10Description: https://datasheet.octopart.com:443/AC0402FR-0711KL-Yageo-datasheet-13029202.pdf?src-supplier=Future+Electronics; ComponentLink11URL: https://datasheet.octopart.com:443/AC0402FR-0711KL-Yageo-Group-datasheet-188689268.pdf?src-supplier=LCSC; ComponentLink11Description: https://datasheet.octopart.com:443/AC0402FR-0711KL-Yageo-Group-datasheet-188689268.pdf?src-supplier=LCSC; ComponentLink12URL: https://datasheet.octopart.com:443/AC0402FR-0711KL-Yageo-Group-datasheet-164768995.pdf?src-supplier=ODG+(Origin+Data+Global); ComponentLink12Description: https://datasheet.octopart.com:443/AC0402FR-0711KL-Yageo-Group-datasheet-164768995.pdf?src-supplier=ODG+(Origin+Data+Global); ComponentLink13URL: https://datasheet.octopart.com:443/AC0402FR-0711KL-Yageo-datasheet-128677928.pdf?src-supplier=X-ON; ComponentLink13Description: https://datasheet.octopart.com:443/AC0402FR-0711KL-Yageo-datasheet-128677928.pdf?src-supplier=X-ON; ComponentLink14URL: http://sigma.octopart.com:80/conflict_mineral_statement/Yageo-company-3.pdf?src-supplier=Compliance+Statements; ComponentLink14Description: http://sigma.octopart.com:80/conflict_mineral_statement/Yageo-company-3.pdf?src-supplier=Compliance+Statements; ComponentLink15URL: http://sigma.octopart.com:80/rohs_statement/Yageo-company-2.pdf?src-supplier=Compliance+Statements; ComponentLink15Description: http://sigma.octopart.com:80/rohs_statement/Yageo-company-2.pdf?src-supplier=Compliance+Statements
R_MDIO R_PWDN = CMP-2002-07181-1: Res Thick Film 0402 2.2K Ohm 1% 0.063W(1/16W) ±100ppm/C Molded SMD Automotive Paper T/R; Manufacturer: Vishay; Max Power Dissipation: 63mW; Value: 2.2kΩ; Temperature Coefficient: 100ppm/°C; Voltage Rating: 50V; Supplier: Avnet; Supplier Part Number: CRCW04022K20FKTD; Manufacturer Part Number: CRCW04022K20FKTD; Category: Chip SMD Resistors; Stock: 10000; Pricing: 10000=0.00956 (USD); Case/Package: 0402; Case Code (Imperial): 0402; China RoHS: Non-Compliant; Composition: Thick Film; Country of Origin: Israel; Depth: 500µm; Export Control Classification Number (ECCN) Code: EAR99; Features: Automotive AEC-Q200; Height: 350µm; Harmonized Tariff Schedule (HTS) Code: 8533.21.00.30; Introduction Date: 2005-09-28; Lead Free: Contains Lead; Length: 1mm; Lifecycle Status: Production; Max Operating Temperature: 155°C; Military Standard: Not; Min Operating Temperature: -55°C; Mounting Technology: Surface Mount; Number of Terminals: 2; Number of Terminations: 2; Packaging: Tape & Reel (TR); Power Rating: 63mW; Ratings: AEC-Q200; REACH SVHC: Affected; RoHS: Non-Compliant; Tolerance: 1%; Voltage Rating (DC): 50V; Weight: 652.039032µg; Width: 500µm; Working Voltage: 50V; ComponentLink1URL: https://datasheet.octopart.com:443/CRCW04022K20FKTD-Vishay-datasheet-175863636.pdf?src-supplier=IHS; ComponentLink1Description: https://datasheet.octopart.com:443/CRCW04022K20FKTD-Vishay-datasheet-175863636.pdf?src-supplier=IHS; ComponentLink2URL: https://datasheet.octopart.com:443/CRCW04022K20FKTD-Vishay-datasheet-182027442.pdf?src-supplier=IHS; ComponentLink2Description: https://datasheet.octopart.com:443/CRCW04022K20FKTD-Vishay-datasheet-182027442.pdf?src-supplier=IHS; ComponentLink3URL: https://datasheet.octopart.com/D-CRCW-Lead-%28Pb%29-Bearing-Thick-Film%2C-Rectangular-Chip-Resistors-Vishay-datasheet-family-72.pdf; ComponentLink3Description: https://datasheet.octopart.com/D-CRCW-Lead-%28Pb%29-Bearing-Thick-Film%2C-Rectangular-Chip-Resistors-Vishay-datasheet-family-72.pdf; ComponentLink4URL: https://datasheet.octopart.com/CRCW04022K20FKTD-Vishay-datasheet-13242068.pdf; ComponentLink4Description: https://datasheet.octopart.com/CRCW04022K20FKTD-Vishay-datasheet-13242068.pdf; ComponentLink5URL: https://datasheet.octopart.com/CRCW04022K20FKTD-Vishay-datasheet-13195083.pdf; ComponentLink5Description: https://datasheet.octopart.com/CRCW04022K20FKTD-Vishay-datasheet-13195083.pdf; ComponentLink6URL: https://datasheet.octopart.com/CRCW04022K20FKTD-Vishay-datasheet-13034211.pdf; ComponentLink6Description: https://datasheet.octopart.com/CRCW04022K20FKTD-Vishay-datasheet-13034211.pdf; ComponentLink7URL: https://datasheet.octopart.com/CRCW04022K20FKTD-Vishay-datasheet-12600034.pdf; ComponentLink7Description: https://datasheet.octopart.com/CRCW04022K20FKTD-Vishay-datasheet-12600034.pdf; ComponentLink8URL: https://datasheet.octopart.com/CRCW04022K20FKTD-Vishay-datasheet-12532161.pdf; ComponentLink8Description: https://datasheet.octopart.com/CRCW04022K20FKTD-Vishay-datasheet-12532161.pdf; ComponentLink9URL: https://datasheet.octopart.com/CRCW04022K20FKTD-Vishay-datasheet-12517896.pdf; ComponentLink9Description: https://datasheet.octopart.com/CRCW04022K20FKTD-Vishay-datasheet-12517896.pdf; ComponentLink10URL: https://datasheet.octopart.com/CRCW04022K20FKTD-Vishay-datasheet-12509762.pdf; ComponentLink10Description: https://datasheet.octopart.com/CRCW04022K20FKTD-Vishay-datasheet-12509762.pdf; ComponentLink11URL: https://datasheet.octopart.com/CRCW04022K20FKTD-Vishay-datasheet-10322335.pdf; ComponentLink11Description: https://datasheet.octopart.com/CRCW04022K20FKTD-Vishay-datasheet-10322335.pdf; ComponentLink12URL: https://datasheet.octopart.com/CRCW04022K20FKTD-Vishay-datasheet-8788789.pdf; ComponentLink12Description: https://datasheet.octopart.com/CRCW04022K20FKTD-Vishay-datasheet-8788789.pdf; ComponentLink13URL: https://datasheet.octopart.com/CRCW04022K20FKTD-Vishay-datasheet-8361388.pdf; ComponentLink13Description: https://datasheet.octopart.com/CRCW04022K20FKTD-Vishay-datasheet-8361388.pdf; ComponentLink14URL: https://datasheet.octopart.com/CRCW04022K20FKTD-Vishay-datasheet-5306405.pdf; ComponentLink14Description: https://datasheet.octopart.com/CRCW04022K20FKTD-Vishay-datasheet-5306405.pdf; ComponentLink15URL: https://datasheet.octopart.com/CRCW04022K20FKTD-Vishay-datasheet-546287.pdf; ComponentLink15Description: https://datasheet.octopart.com/CRCW04022K20FKTD-Vishay-datasheet-546287.pdf; ComponentLink16URL: http://sigma.octopart.com:80/rohs_statement/Vishay-company-15.pdf?src-supplier=Compliance+Statements; ComponentLink16Description: http://sigma.octopart.com:80/rohs_statement/Vishay-company-15.pdf?src-supplier=Compliance+Statements
R_RESET R_STRAP1 = CMP-2002-07181-1: Res Thick Film 0402 10K Ohm 5% 0.063W(1/16W) ±100ppm/C Pad SMD T/R Automotive AEC-Q200; Manufacturer: Yageo Group; Power Rating: 62.5mW; Value: 10kΩ; Temperature Coefficient: 100ppm/°C; Voltage Rating: 50V; Supplier: Future Electronics; Supplier Part Number: AC0402JR-1310KL; Manufacturer Part Number: AC0402JR-1310KL; RoHS: Compliant; Category: Chip SMD Resistors; Stock: 500000; Pricing: 50000=0.0045, 100000=0.0044, 150000=0.0043, 200000=0.0043, 250000=0.0042 (USD); Case/Package: 0402; China RoHS: Non-Compliant; Composition: Thick Film; Country of Origin: Mainland China, Taiwan; Export Control Classification Number (ECCN) Code: EAR99; Height: 320µm; Harmonized Tariff Schedule (HTS) Code: 8533.21.00.30; Introduction Date: 2012-04-10; Length: 1mm; Lifecycle Status: Production; Max Operating Temperature: 155°C; Min Operating Temperature: -55°C; Mounting Technology: Surface Mount; Number of Terminals: 2; Packaging: Tape & Reel; Ratings: AEC-Q200; REACH SVHC: Unaffected; Tolerance: 5%; Width: 500µm; Working Voltage: 50V; ComponentLink1URL: https://datasheet.octopart.com:443/AC0402JR-1310KL-Yageo-datasheet-182189377.pdf?src-supplier=IHS; ComponentLink1Description: https://datasheet.octopart.com:443/AC0402JR-1310KL-Yageo-datasheet-182189377.pdf?src-supplier=IHS; ComponentLink2URL: https://datasheet.octopart.com:443/AC0402JR-1310KL-Yageo-datasheet-83209224.pdf?src-supplier=Upverter; ComponentLink2Description: https://datasheet.octopart.com:443/AC0402JR-1310KL-Yageo-datasheet-83209224.pdf?src-supplier=Upverter; ComponentLink3URL: https://datasheet.octopart.com:443/AC0402JR-1310KL-Yageo-datasheet-178509465.pdf?src-supplier=Newark; ComponentLink3Description: https://datasheet.octopart.com:443/AC0402JR-1310KL-Yageo-datasheet-178509465.pdf?src-supplier=Newark; ComponentLink4URL: https://datasheet.octopart.com:443/AC0402JR-1310KL-Yageo-datasheet-166720450.pdf?src-supplier=Future+Electronics; ComponentLink4Description: https://datasheet.octopart.com:443/AC0402JR-1310KL-Yageo-datasheet-166720450.pdf?src-supplier=Future+Electronics; ComponentLink5URL: https://datasheet.octopart.com:443/AC0402JR-1310KL-Yageo-datasheet-151884373.pdf?src-supplier=Future+Electronics; ComponentLink5Description: https://datasheet.octopart.com:443/AC0402JR-1310KL-Yageo-datasheet-151884373.pdf?src-supplier=Future+Electronics; ComponentLink6URL: https://datasheet.octopart.com:443/AC0402JR-1310KL-Yageo-datasheet-137699919.pdf?src-supplier=Future+Electronics; ComponentLink6Description: https://datasheet.octopart.com:443/AC0402JR-1310KL-Yageo-datasheet-137699919.pdf?src-supplier=Future+Electronics; ComponentLink7URL: https://datasheet.octopart.com/AC0402JR-1310KL-Yageo-datasheet-12512238.pdf; ComponentLink7Description: https://datasheet.octopart.com/AC0402JR-1310KL-Yageo-datasheet-12512238.pdf; ComponentLink8URL: http://sigma.octopart.com:80/conflict_mineral_statement/Yageo-company-3.pdf?src-supplier=Compliance+Statements; ComponentLink8Description: http://sigma.octopart.com:80/conflict_mineral_statement/Yageo-company-3.pdf?src-supplier=Compliance+Statements; ComponentLink9URL: http://sigma.octopart.com:80/rohs_statement/Yageo-company-2.pdf?src-supplier=Compliance+Statements; ComponentLink9Description: http://sigma.octopart.com:80/rohs_statement/Yageo-company-2.pdf?src-supplier=Compliance+Statements
R_SHIELD = CMP-03412-048602-1: Anti-Sulfurated Chip Resistor Automotive Grade 1MΩ 5% 0.25W ±100ppm/°C 1206; Resistance: 1MR; Max Power Dissipation: 250mW; Width: 0.063inch; Temperature Coefficient: 100ppm/°C; Case/Package: 1206; Packaging: Tape and Reel; Height: 0.026inch; RoHS Compliant: Yes; Max Operating Temperature: 155°C; Series: AF; Resistor Type: Thick Film; Number of Terminations: 2; Min Operating Temperature: -55°C; Tolerance: 5%; Length: 0.122inch; Features: Moisture Resistant
SW_RESET = CMP-1455-00006-7: Off-Mom SPST-NO 2.6N 500000Cycles 250μm 3.5mm SMD mount，glue mount 6.2mm*6.2mm*3.5mm; Manufacturer Lifecycle Status: ACTIVE; Voltage Rating: 12V; Mechanical Life: 500kcycles; YEOL: 1 = Estimated lifetime > 10 years; Actuator Material: Liquid Crystal Polymer, Polymer; Throw Configuration: SPST; Insulation Resistance: 100MΩ; Illumination Type: Non-Illuminated; Current Rating: 50mA; RoHS: Compliant; Switch Function: Off-Mom; Packaging: Tape and Reel; Contact Plating: Silver; Switch Travel: 250µm; Mount: Surface Mount; Max Operating Temperature: 85°C; Min Operating Temperature: -40°C; Height: 3.5mm; Lifecycle Status: Production
T? = CMP-03913-134708871-3: Xfmr, 1000 Base-T Non-Poe, 350Uh Rohs Compliant: Yes; Manufacturer Lifecycle Status: ACTIVE; Inductance: 350µH; Insertion Loss (dB): -1dB; YEOL: 1 = Estimated lifetime > 10 years; Length: 21.5mm; Max Operating Temperature: 85°C; Height: 13.8mm; Min Operating Temperature: -40°C; Width: 15.75mm; Lifecycle Status: Production; RoHS: Compliant
U?#1 = CMP-04874-000001-1: IC ETHERNET PHY 48VQFN; Manufacturer: Texas Instruments; Min Supply Voltage: 0.95V; Max Junction Temp: +105°C; Simplex Duplex: Full Duplex; Nominal Supply Current: 24-137mA; Standoff Height: 0mm; Data Rate: 1000Mbits/s; Max Supply Voltage: 3.45V; Octopart: https://octopart.com/dp83867irrgzr-texas+instruments-61842583; Digikey Description: IC ETHERNET PHY 48VQFN; Category: IC; Device Class L3: Ethernet Interface ICs; ComponentLink2Description: Datasheet; RoHS: TRUE; Temperature: -40°C to +85°C; Device Class L2: Interface ICs; Package: RGZ0048B; Temperature Range High: +85°C; ComponentLink2URL: http://www.ti.com/lit/ds/symlink/dp83867ir.pdf; Device Class L1: Integrated Circuits (ICs); Lead Free: Yes; Manufacturer Part Number: DP83867IRRGZR; Mouser Description: Ethernet ICs 10/100/1000 ENET PHY; Automotive: No; Temperature Range Low: -40°C; Height: 1mm; Interface: Ethernet
Y?#1 = CMP-36405-000019-1: CRYSTAL 25.0000MHZ 18PF SMD; ESR (Equivalent Series Resistance): 40R; Frequency Stability: 10ppm; Frequency: 25MHz; Max Operating Temperature: 85°C; Length: 3.2mm; Packaging: Tape and Reel; Min Operating Temperature: -20°C; Depth: 2.5mm; Case/Package: SMD/SMT; Load Capacitance: 18pF; Number of Pins: 4

## Sheet 02_PHY_Automotive.SchDoc
size B; SheetNumber: 2; SheetTotal: 5
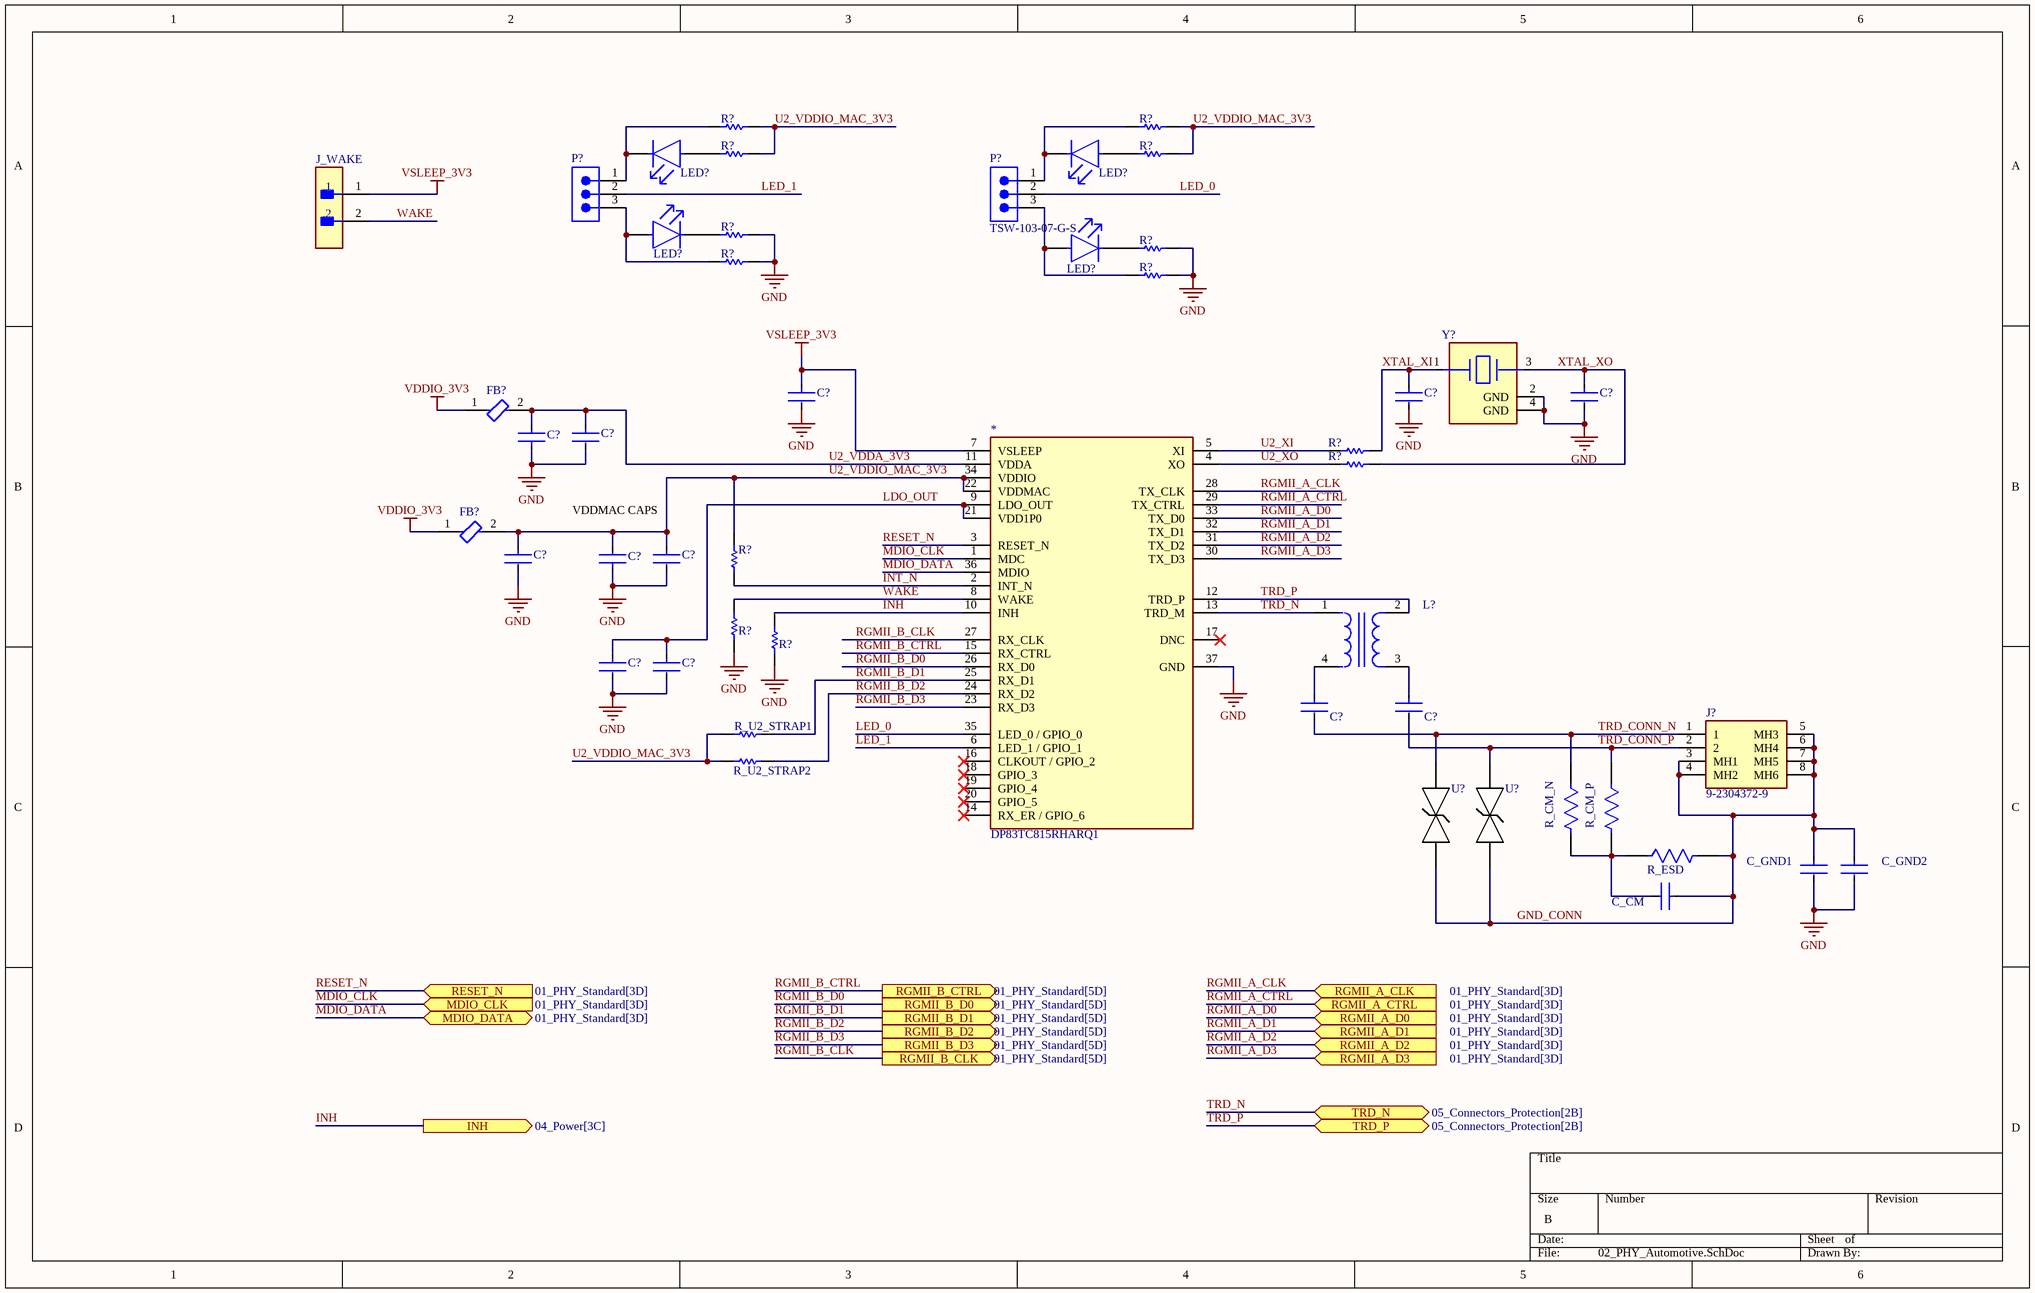
[diagram p1: 02_PHY_Automotive.SchDoc]